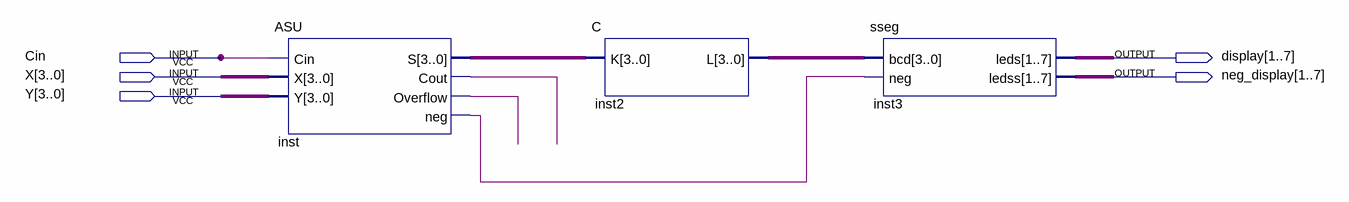
[diagram p0: schematic sheet]
// Quartus schematic CombinedASU2.bdf as structural Verilog: 3 symbols, 5 pins
module CombinedASU2 (
  input  Cin,
  input  [3:0] X,
  input  [3:0] Y,
  output [1:7] display,
  output [1:7] neg_display
);

  wire inst_cout, inst_neg, inst_overflow;
  wire [3:0] inst2_l, inst_s;

  ASU inst (.Cin(Cin), .X(X), .Y(Y), .S(inst_s), .Cout(inst_cout), .Overflow(inst_overflow), .neg(inst_neg));
  C inst2 (.K(inst_s), .L(inst2_l));
  sseg inst3 (.bcd(inst2_l), .neg(inst_neg), .leds(display), .ledss(neg_display));
endmodule
